# Altium schematic sheet MCU.SchDoc
size A4; SheetNumber: 2; SheetTotal: 5
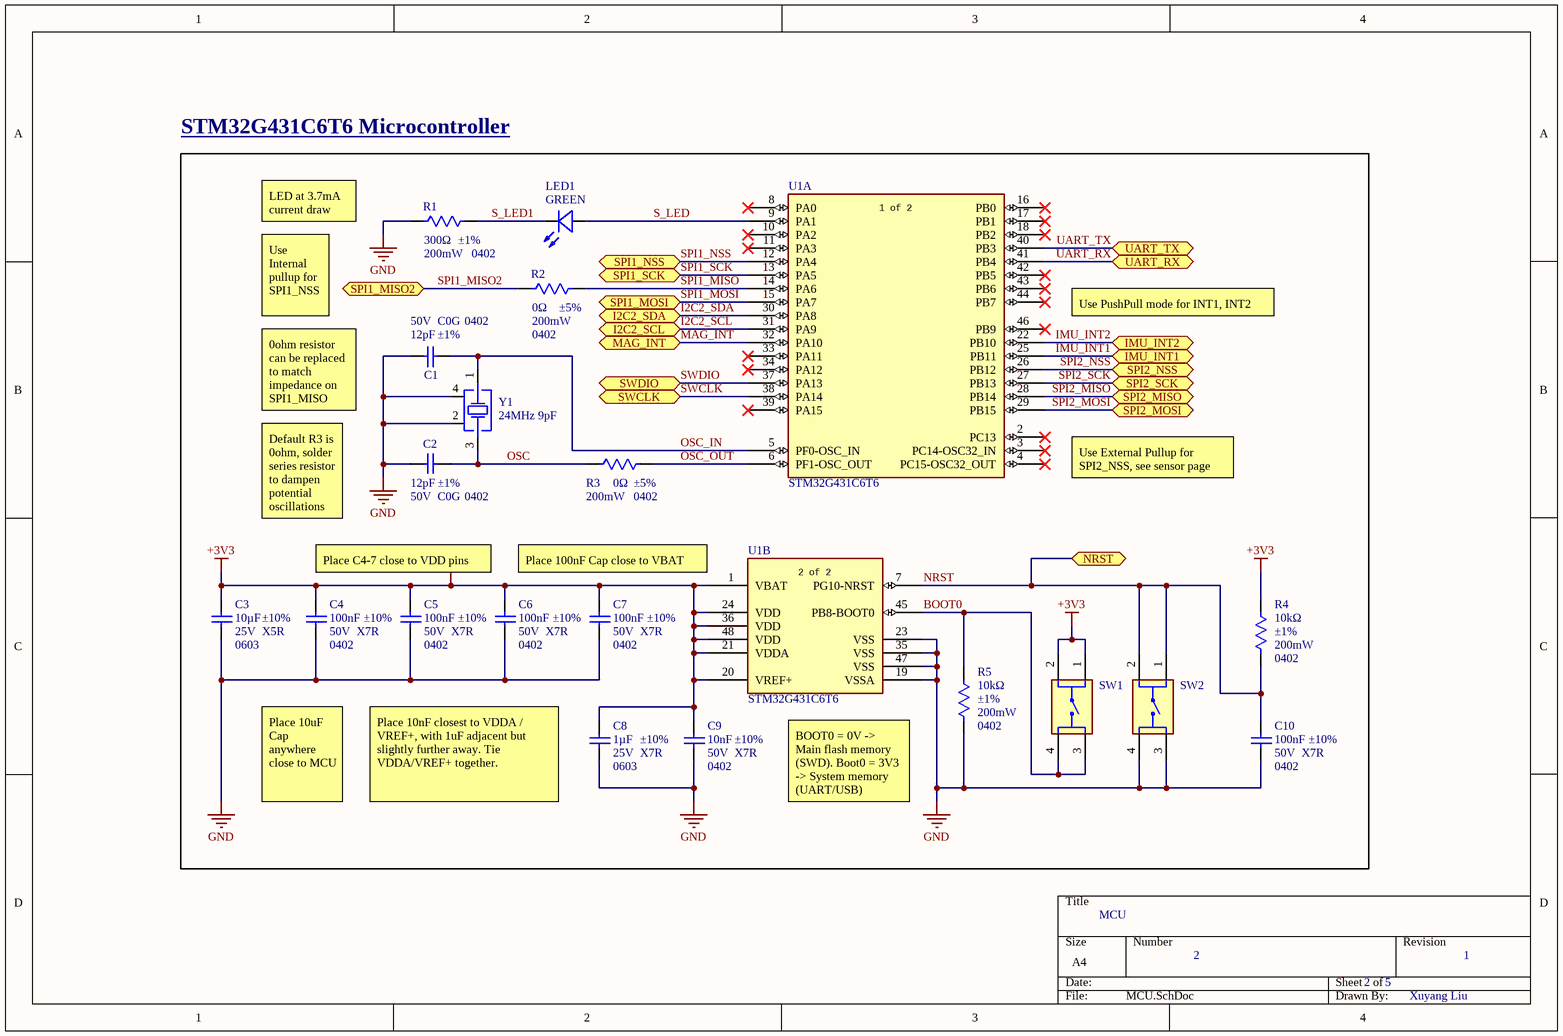
[diagram p0: MCU.SchDoc]

## Parts
C1  Voltage Rating: 50V  Tolerance: ±1%  Dielectric: C0G  Case/Package: 0402  [0402_Cap]  (hidden comment: 12pF)
C2  Voltage Rating: 50V  Tolerance: ±1%  Dielectric: C0G  Case/Package: 0402  [0402_Cap]  (hidden comment: 12pF)
C3  Voltage Rating: 25V  Tolerance: ±10%  Dielectric: X5R  Case/Package: 0603  Capacitance: 10µF  [0603_CAP]  (hidden comment: 10uF)
C4  Case/Package: 0402  Voltage Rating: 50V  Dielectric: X7R  Tolerance: ±10%  [0402_Cap]  (hidden comment: 100nF)
C5  Case/Package: 0402  Voltage Rating: 50V  Dielectric: X7R  Tolerance: ±10%  [0402_Cap]  (hidden comment: 100nF)
C6  Case/Package: 0402  Voltage Rating: 50V  Dielectric: X7R  Tolerance: ±10%  [0402_Cap]  (hidden comment: 100nF)
C7  Case/Package: 0402  Voltage Rating: 50V  Dielectric: X7R  Tolerance: ±10%  [0402_Cap]  (hidden comment: 100nF)
C8  Voltage: 25V  Tolerance: ±10%  Dielectric: X7R  Case/Package: 0603  Capacitance: 1µF  [0603_CAP]  (hidden comment: 1uF)
C9  Voltage: 50V  Tolerance: ±10%  Dielectric: X7R  Case/Package: 0402  [0402_Cap]  (hidden comment: 10nF)
C10  Case/Package: 0402  Voltage Rating: 50V  Dielectric: X7R  Tolerance: ±10%  [0402_Cap]  (hidden comment: 100nF)
LED1  GREEN  [0603_LED]
R1  Tolerance: ±1%  Max Power Dissipation: 200mW  Case/Package: 0402  Resistance: 300Ω  [0402_RES]  (hidden comment: 300R)
R2  Tolerance: ±5%  Power Rating: 200mW  Case/Package: 0402  Resistance: 0Ω  [0402_RES]  (hidden comment: 0R)
R3  Tolerance: ±5%  Power Rating: 200mW  Case/Package: 0402  Resistance: 0Ω  [0402_RES]  (hidden comment: 0R)
R4  Tolerance: ±1%  Power Rating: 200mW  Case/Package: 0402  Resistance: 10kΩ  [0402_RES]  (hidden comment: 10K)
R5  Tolerance: ±1%  Power Rating: 200mW  Case/Package: 0402  Resistance: 10kΩ  [0402_RES]  (hidden comment: 10K)
SW1  SPST N.O. Button  [SW4_PTS815 SJM 250 SMTR LFS_CNK]  (value not drawn)
SW2  SPST N.O. Button  [SW4_PTS815 SJM 250 SMTR LFS_CNK]  (value not drawn)
U1  STM32G431C6T6  [LQFP48-7x7mm]  (parts A,B of 2)
Y1  24MHz 9pF  [OSCCC320X250X60]

## Blocks framed on the sheet
STM32G431C6T6 Microcontroller: C1-C10 LED1 R1-R5 SW1 SW2 U1 Y1

## Ports
I2C2_SCL (bidir), I2C2_SDA (bidir), IMU_INT1 (bidir), IMU_INT2 (bidir), MAG_INT (bidir), NRST (bidir), SPI1_MISO2 (bidir), SPI1_MOSI (bidir), SPI1_NSS (bidir), SPI1_SCK (bidir), SPI2_MISO (bidir), SPI2_MOSI (bidir), SPI2_NSS (bidir), SPI2_SCK (bidir), SWCLK (bidir), SWDIO (bidir), UART_RX (bidir), UART_TX (bidir)

## Nets
+3V3: C3.2 C4.2 C5.2 C6.2 C7.2 C8.2 C9.2 R4.2 SW1.1 SW1.2 U1.1(VBAT) U1.20(VREF+) U1.21(VDDA) U1.24(VDD) U1.36(VDD) U1.48(VDD)
GND: C1.1 C2.2 C3.1 C4.1 C5.1 C6.1 C7.1 C8.1 C9.1 C10.1 R1.1 R5.1 SW2.3 SW2.4 U1.19(VSSA) U1.23(VSS) U1.35(VSS) U1.47(VSS) Y1.2 Y1.4
BOOT0: R5.2 SW1.3 SW1.4 U1.45(PB8-BOOT0)
I2C2_SCL: U1.31(PA9) ; port I2C2_SCL
I2C2_SDA: U1.30(PA8) ; port I2C2_SDA
IMU_INT1: U1.25(PB11) ; port IMU_INT1
IMU_INT2: U1.22(PB10) ; port IMU_INT2
MAG_INT: U1.32(PA10) ; port MAG_INT
NRST: C10.2 R4.1 SW2.1 SW2.2 U1.7(PG10-NRST) ; port NRST
OSC: C2.1 R3.1 Y1.3
OSC_IN: C1.2 U1.5(PF0-OSC_IN) Y1.1
OSC_OUT: R3.2 U1.6(PF1-OSC_OUT)
S_LED: LED1.A(V+) U1.9(PA1)
S_LED1: LED1.C(V-) R1.2
SPI1_MISO: R2.2 U1.14(PA6)
SPI1_MISO2: R2.1 ; port SPI1_MISO2
SPI1_MOSI: U1.15(PA7) ; port SPI1_MOSI
SPI1_NSS: U1.12(PA4) ; port SPI1_NSS
SPI1_SCK: U1.13(PA5) ; port SPI1_SCK
SPI2_MISO: U1.28(PB14) ; port SPI2_MISO
SPI2_MOSI: U1.29(PB15) ; port SPI2_MOSI
SPI2_NSS: U1.26(PB12) ; port SPI2_NSS
SPI2_SCK: U1.27(PB13) ; port SPI2_SCK
SWCLK: U1.38(PA14) ; port SWCLK
SWDIO: U1.37(PA13) ; port SWDIO
UART_RX: U1.41(PB4) ; port UART_RX
UART_TX: U1.40(PB3) ; port UART_TX

Not connected (* = marked no-connect by the designer): U1 2(PC13)* 3(PC14-OSC32_IN)* 4(PC15-OSC32_OUT)* 8(PA0)* 10(PA2)* 11(PA3)* 16(PB0)* 17(PB1)* 18(PB2)* 33(PA11)* 34(PA12)* 39(PA15)* 42(PB5)* 43(PB6)* 44(PB7)* 46(PB9)*

## Notes on the sheet
- LED at 3.7mA current draw
- Use Internal pullup for SPI1_NSS
- Use PushPull mode for INT1, INT2
- 0ohm resistor can be replaced to match impedance on SPI1_MISO
- Default R3 is 0ohm, solder series resistor to dampen potential oscillations
- Use External Pullup for SPI2_NSS, see sensor page
- Place C4-7 close to VDD pins
- Place 100nF Cap close to VBAT
- Place 10uF Cap anywhere close to MCU
- (near C8) Place 10nF closest to VDDA / VREF+, with 1uF adjacent but slightly further away. Tie VDDA/VREF+ together.
- BOOT0 = 0V -> Main flash memory (SWD). Boot0 = 3V3 -> System memory (UART/USB)
- MCU
- 2
- 2     5
- 1
- Xuyang Liu
- (in symbol STM32G431C6T6, part A) 1 of 2
- (in symbol STM32G431C6T6, part B) 2 of 2

## Library data of the parts
C1 C2 = GJM1555C1H120FB01D: 12 pF, 50 V, ± 1%, C0G (NP0), 0402 [1005 Metric]; Manufacturer: Murata; Manufacturer Lifecycle Status: IN PRODUCTION; Dielectric Material: Ceramic; Temperature Coefficient: 30ppm/°C; Supplier 1: DigiKey; Manufacturer Part Number: GJM1555C1H120FB01D; RoHS: Compliant; Category: Ceramic Capacitors; Stock 1: 7555649; Pricing 1: 1=0.16, 10=0.089, 50=0.0628, 100=0.0546, 500=0.04104, 1000=0.03687, 2500=0.03246, 5000=0.02982 (USD); Case Code (Imperial): 0402; Case Code (Metric): 1005; Depth: 500µm; Export Control Classification Number (ECCN) Code: EAR99; Height: 500µm; Harmonized Tariff Schedule (HTS) Code: 8532.24.00.20; Introduction Date: 2013-11-20; Length: 1mm; Lifecycle Status: Production; Material: Ceramic; Max Operating Temperature: 125°C; Min Operating Temperature: -55°C; Mount: Surface Mount; Number of Terminals: 2; Radiation Hardening: No; REACH SVHC: Yes; Schedule B: 8532240020, 8532240020|8532240020|8532240020|8532240020|8532240020; Termination: SMD/SMT; Thickness: 500µm; Voltage Rating (DC): 50V; Width: 500µm; ComponentLink1URL: https://datasheet.octopart.com:443/GJM1555C1H120FB01D-Murata-datasheet-165579666.pdf?src-supplier=TME; ComponentLink1Description: https://datasheet.octopart.com:443/GJM1555C1H120FB01D-Murata-datasheet-165579666.pdf?src-supplier=TME; ComponentLink2URL: https://datasheet.octopart.com:443/GJM1555C1H120FB01D-Murata-datasheet-12511495.pdf?src-supplier=TME; ComponentLink2Description: https://datasheet.octopart.com:443/GJM1555C1H120FB01D-Murata-datasheet-12511495.pdf?src-supplier=TME; ComponentLink3URL: https://datasheet.octopart.com:443/GJM1555C1H120FB01D-Murata-datasheet-141266224.pdf?src-supplier=Ciiva; ComponentLink3Description: https://datasheet.octopart.com:443/GJM1555C1H120FB01D-Murata-datasheet-141266224.pdf?src-supplier=Ciiva; ComponentLink4URL: https://datasheet.octopart.com:443/GJM1555C1H120FB01D-Murata-datasheet-140665264.pdf?src-supplier=Ciiva; ComponentLink4Description: https://datasheet.octopart.com:443/GJM1555C1H120FB01D-Murata-datasheet-140665264.pdf?src-supplier=Ciiva; ComponentLink5URL: https://datasheet.octopart.com:443/GJM1555C1H120FB01D-Murata-datasheet-138724487.pdf?src-supplier=Ciiva; ComponentLink5Description: https://datasheet.octopart.com:443/GJM1555C1H120FB01D-Murata-datasheet-138724487.pdf?src-supplier=Ciiva; ComponentLink6URL: https://datasheet.octopart.com/GJM1555C1H120FB01D-Murata-datasheet-12515295.pdf; ComponentLink6Description: https://datasheet.octopart.com/GJM1555C1H120FB01D-Murata-datasheet-12515295.pdf; ComponentLink7URL: https://datasheet.octopart.com/GJM1555C1H120FB01D-Murata-datasheet-12510076.pdf; ComponentLink7Description: https://datasheet.octopart.com/GJM1555C1H120FB01D-Murata-datasheet-12510076.pdf; ComponentLink8URL: https://datasheet.octopart.com/GJM1555C1H120FB01D-Murata-datasheet-11978611.pdf; ComponentLink8Description: https://datasheet.octopart.com/GJM1555C1H120FB01D-Murata-datasheet-11978611.pdf; ComponentLink9URL: https://datasheet.octopart.com/GJM1555C1H120FB01D-Murata-datasheet-10025737.pdf; ComponentLink9Description: https://datasheet.octopart.com/GJM1555C1H120FB01D-Murata-datasheet-10025737.pdf; ComponentLink10URL: https://datasheet.octopart.com/GJM1555C1H120FB01D-Murata-datasheet-8819587.pdf; ComponentLink10Description: https://datasheet.octopart.com/GJM1555C1H120FB01D-Murata-datasheet-8819587.pdf; ComponentLink11URL: https://datasheet.octopart.com/GJM1555C1H120FB01D-Murata-datasheet-14407173.pdf; ComponentLink11Description: https://datasheet.octopart.com/GJM1555C1H120FB01D-Murata-datasheet-14407173.pdf; ComponentLink12URL: http://sigma.octopart.com:80/reach_statement/Murata-company-16.pdf?src-supplier=Compliance+Statements; ComponentLink12Description: http://sigma.octopart.com:80/reach_statement/Murata-company-16.pdf?src-supplier=Compliance+Statements; Supplier Part Number 1: 490-11190-1-ND; Capacitance: 12pF
C3 = GRM188R61E106KA73J: 25V 10uF X7R ±10% 0603 Multilayer Ceramic Capacitors MLCC - SMD/SMT ROHS; Manufacturer: Murata; Manufacturer Lifecycle Status: IN PRODUCTION; Supplier 1: DigiKey; Manufacturer Part Number: GRM188R61E106KA73J; RoHS: Compliant; Category: Ceramic Capacitors; Stock 1: 170211; Pricing 1: 1=0.26, 10=0.149, 50=0.1072, 100=0.0945, 500=0.07304, 1000=0.06643, 2500=0.05947, 5000=0.05528 (USD); Dielectric Material: Ceramic; Height: 800µm; Length: 1.6mm; Lifecycle Status: Production; Material: Ceramic; Max Operating Temperature: 85°C; Min Operating Temperature: -55°C; Mount: Surface Mount; Number of Terminals: 2; REACH SVHC: Yes; Thickness: 800µm; Voltage Rating (DC): 25V; Width: 800µm; ComponentLink1URL: https://datasheet.octopart.com:443/GRM188R61E106KA73J-Murata-datasheet-165579666.pdf?src-supplier=TME; ComponentLink1Description: https://datasheet.octopart.com:443/GRM188R61E106KA73J-Murata-datasheet-165579666.pdf?src-supplier=TME; ComponentLink2URL: https://datasheet.octopart.com:443/GRM188R61E106KA73J-Murata-datasheet-141274968.pdf?src-supplier=Ciiva; ComponentLink2Description: https://datasheet.octopart.com:443/GRM188R61E106KA73J-Murata-datasheet-141274968.pdf?src-supplier=Ciiva; ComponentLink3URL: https://datasheet.octopart.com:443/GRM188R61E106KA73J-Murata-datasheet-140704821.pdf?src-supplier=Ciiva; ComponentLink3Description: https://datasheet.octopart.com:443/GRM188R61E106KA73J-Murata-datasheet-140704821.pdf?src-supplier=Ciiva; ComponentLink4URL: https://datasheet.octopart.com:443/GRM188R61E106KA73J-Murata-datasheet-138742889.pdf?src-supplier=Ciiva; ComponentLink4Description: https://datasheet.octopart.com:443/GRM188R61E106KA73J-Murata-datasheet-138742889.pdf?src-supplier=Ciiva; ComponentLink5URL: https://datasheet.octopart.com/GRM188R61E106KA73J-Murata-datasheet-12515295.pdf; ComponentLink5Description: https://datasheet.octopart.com/GRM188R61E106KA73J-Murata-datasheet-12515295.pdf; ComponentLink6URL: https://datasheet.octopart.com/GRM188R61E106KA73J-Murata-datasheet-12510076.pdf; ComponentLink6Description: https://datasheet.octopart.com/GRM188R61E106KA73J-Murata-datasheet-12510076.pdf; ComponentLink7URL: https://datasheet.octopart.com/GRM188R61E106KA73J-Murata-datasheet-11978611.pdf; ComponentLink7Description: https://datasheet.octopart.com/GRM188R61E106KA73J-Murata-datasheet-11978611.pdf; ComponentLink8URL: https://datasheet.octopart.com/GRM188R61E106KA73J-Murata-datasheet-10025737.pdf; ComponentLink8Description: https://datasheet.octopart.com/GRM188R61E106KA73J-Murata-datasheet-10025737.pdf; ComponentLink9URL: https://datasheet.octopart.com/GRM188R61E106KA73J-Murata-datasheet-8819587.pdf; ComponentLink9Description: https://datasheet.octopart.com/GRM188R61E106KA73J-Murata-datasheet-8819587.pdf; ComponentLink10URL: http://sigma.octopart.com:80/reach_statement/Murata-company-16.pdf?src-supplier=Compliance+Statements; ComponentLink10Description: http://sigma.octopart.com:80/reach_statement/Murata-company-16.pdf?src-supplier=Compliance+Statements; Supplier Part Number 1: 490-GRM188R61E106KA73JCT-ND
C4-C7 C10 = GCM155R71H104KE02J: 50V 100nF X7R ±10% 0402 Multilayer Ceramic Capacitors MLCC - SMD/SMT ROHS; Manufacturer: Murata; Manufacturer Lifecycle Status: IN PRODUCTION; Supplier 1: DigiKey; Manufacturer Part Number: GCM155R71H104KE02J; RoHS: Compliant; Category: Ceramic Capacitors; Stock 1: 13930662; Pricing 1: 1=0.1, 10=0.034, 50=0.0226, 100=0.0193, 500=0.01374, 1000=0.01205, 2500=0.01027, 5000=0.0092 (USD); Case Code (Imperial): 0402; Case Code (Metric): 1005; Country of Origin: Philippines; Dielectric Material: Ceramic; Export Control Classification Number (ECCN) Code: EAR99; Height: 500µm; Harmonized Tariff Schedule (HTS) Code: 8532.24.00.20; Introduction Date: 2013-11-20; Length: 1mm; Lifecycle Status: Production; Material: Ceramic; Max Operating Temperature: 125°C; Min Operating Temperature: -55°C; Mount: Surface Mount; Number of Terminals: 2; Packaging: Tape & Reel (TR); Ratings: AEC-Q200; REACH SVHC: Yes; Schedule B: 8532240020, 8532240020|8532240020, 8532240020|8532240020|8532240020, 8532240020|8532240020|8532240020|8532240020; Termination: SMD/SMT; Voltage Rating (DC): 50V; Weight: 6.010099mg; Width: 500µm; ComponentLink1URL: https://datasheet.octopart.com:443/GCM155R71H104KE02J-Murata-datasheet-155345015.pdf?src-supplier=Newark; ComponentLink1Description: https://datasheet.octopart.com:443/GCM155R71H104KE02J-Murata-datasheet-155345015.pdf?src-supplier=Newark; ComponentLink2URL: https://datasheet.octopart.com:443/GCM155R71H104KE02J-Murata-datasheet-178519985.pdf?src-supplier=Arrow.cn; ComponentLink2Description: https://datasheet.octopart.com:443/GCM155R71H104KE02J-Murata-datasheet-178519985.pdf?src-supplier=Arrow.cn; ComponentLink3URL: https://datasheet.octopart.com:443/GCM155R71H104KE02J-Murata-datasheet-141266224.pdf?src-supplier=Ciiva; ComponentLink3Description: https://datasheet.octopart.com:443/GCM155R71H104KE02J-Murata-datasheet-141266224.pdf?src-supplier=Ciiva; ComponentLink4URL: https://datasheet.octopart.com:443/GCM155R71H104KE02J-Murata-datasheet-140656751.pdf?src-supplier=Ciiva; ComponentLink4Description: https://datasheet.octopart.com:443/GCM155R71H104KE02J-Murata-datasheet-140656751.pdf?src-supplier=Ciiva; ComponentLink5URL: https://datasheet.octopart.com:443/GCM155R71H104KE02J-Murata-datasheet-138716456.pdf?src-supplier=Ciiva; ComponentLink5Description: https://datasheet.octopart.com:443/GCM155R71H104KE02J-Murata-datasheet-138716456.pdf?src-supplier=Ciiva; ComponentLink6URL: https://datasheet.octopart.com:443/GCM155R71H104KE02J-Murata-datasheet-77992203.pdf?src-supplier=Future+Electronics; ComponentLink6Description: https://datasheet.octopart.com:443/GCM155R71H104KE02J-Murata-datasheet-77992203.pdf?src-supplier=Future+Electronics; ComponentLink7URL: https://datasheet.octopart.com:443/GCM155R71H104KE02J-Murata-datasheet-12511495.pdf?src-supplier=TME; ComponentLink7Description: https://datasheet.octopart.com:443/GCM155R71H104KE02J-Murata-datasheet-12511495.pdf?src-supplier=TME; ComponentLink8URL: http://sigma.octopart.com:80/reach_statement/Murata-company-16.pdf?src-supplier=Compliance+Statements; ComponentLink8Description: http://sigma.octopart.com:80/reach_statement/Murata-company-16.pdf?src-supplier=Compliance+Statements; Supplier Part Number 1: 490-14514-6-ND; Capacitance: 100nF
C8 = GCM188R71E105KA64D: 25V 1uF X7R ±10% 0603 Multilayer Ceramic Capacitors MLCC - SMD/SMT ROHS; Manufacturer: Murata; Manufacturer Lifecycle Status: IN PRODUCTION; Supplier 1: DigiKey; Manufacturer Part Number: GCM188R71E105KA64D; RoHS: Compliant; Category: Ceramic Capacitors; Stock 1: 751115; Pricing 1: 1=0.19, 10=0.106, 50=0.0752, 100=0.0658, 500=0.04994, 1000=0.04504 (USD); Case Code (Imperial): 0603; Case Code (Metric): 1608; Country of Origin: Philippines; Depth: 800µm; Dielectric Material: Ceramic; Export Control Classification Number (ECCN) Code: EAR99; Height: 800µm; Harmonized Tariff Schedule (HTS) Code: 8532.24.00.20; Introduction Date: 2010-10-29; Lead Free: Lead Free; Length: 1.6mm; Lifecycle Status: Production; Material: Ceramic; Max Operating Temperature: 125°C; Min Operating Temperature: -55°C; Mount: Surface Mount; Number of Terminals: 2; Packaging: Cut Tape; Radiation Hardening: No; Ratings: AEC-Q200; REACH SVHC: Yes; Schedule B: 8532240020, 8532240020|8532240020, 8532240020|8532240020|8532240020, 8532240020|8532240020|8532240020|8532240020; Termination: SMD/SMT; Voltage Rating: 25V; Voltage Rating (DC): 25V; Weight: 6.293594mg; Width: 800µm; ComponentLink1URL: https://datasheet.octopart.com:443/GCM188R71E105KA64D-Murata-datasheet-39128443.pdf?src-supplier=Newark; ComponentLink1Description: https://datasheet.octopart.com:443/GCM188R71E105KA64D-Murata-datasheet-39128443.pdf?src-supplier=Newark; ComponentLink2URL: https://datasheet.octopart.com:443/GCM188R71E105KA64D-Murata-datasheet-62316951.pdf?src-supplier=element14+APAC; ComponentLink2Description: https://datasheet.octopart.com:443/GCM188R71E105KA64D-Murata-datasheet-62316951.pdf?src-supplier=element14+APAC; ComponentLink3URL: https://datasheet.octopart.com:443/GCM188R71E105KA64D-Murata-datasheet-141267554.pdf?src-supplier=Geoflip; ComponentLink3Description: https://datasheet.octopart.com:443/GCM188R71E105KA64D-Murata-datasheet-141267554.pdf?src-supplier=Geoflip; ComponentLink4URL: https://datasheet.octopart.com:443/GCM188R71E105KA64D-Murata-datasheet-140658666.pdf?src-supplier=Ciiva; ComponentLink4Description: https://datasheet.octopart.com:443/GCM188R71E105KA64D-Murata-datasheet-140658666.pdf?src-supplier=Ciiva; ComponentLink5URL: https://datasheet.octopart.com:443/GCM188R71E105KA64D-Murata-datasheet-138718232.pdf?src-supplier=Ciiva; ComponentLink5Description: https://datasheet.octopart.com:443/GCM188R71E105KA64D-Murata-datasheet-138718232.pdf?src-supplier=Ciiva; ComponentLink6URL: https://datasheet.octopart.com:443/GCM188R71E105KA64D-Murata-datasheet-81455541.pdf?src-supplier=TME; ComponentLink6Description: https://datasheet.octopart.com:443/GCM188R71E105KA64D-Murata-datasheet-81455541.pdf?src-supplier=TME; ComponentLink7URL: https://datasheet.octopart.com/GCM188R71E105KA64D-Murata-datasheet-14404430.pdf; ComponentLink7Description: https://datasheet.octopart.com/GCM188R71E105KA64D-Murata-datasheet-14404430.pdf; ComponentLink8URL: https://datasheet.octopart.com:443/GCM188R71E105KA64D-Murata-datasheet-14393380.pdf?src-supplier=Future+Electronics; ComponentLink8Description: https://datasheet.octopart.com:443/GCM188R71E105KA64D-Murata-datasheet-14393380.pdf?src-supplier=Future+Electronics; ComponentLink9URL: https://datasheet.octopart.com:443/GCM188R71E105KA64D-Murata-datasheet-44103482.pdf?src-supplier=Future+Electronics; ComponentLink9Description: https://datasheet.octopart.com:443/GCM188R71E105KA64D-Murata-datasheet-44103482.pdf?src-supplier=Future+Electronics; ComponentLink10URL: http://sigma.octopart.com:80/reach_statement/Murata-company-16.pdf?src-supplier=Compliance+Statements; ComponentLink10Description: http://sigma.octopart.com:80/reach_statement/Murata-company-16.pdf?src-supplier=Compliance+Statements; Supplier Part Number 1: 490-10673-1-ND
C9 = GCM155R71H103KA55D: 50V 10nF X7R ±10% 0402 Multilayer Ceramic Capacitors MLCC - SMD/SMT ROHS; Manufacturer: Murata; Manufacturer Lifecycle Status: IN PRODUCTION; Manufacturer Part Number: GCM155R71H103KA55D; RoHS: Compliant; Category: Ceramic Capacitors; Stock 1: 3983526; Pricing 1: 1=0.1, 10=0.026, 50=0.0172, 100=0.0146, 500=0.01026, 1000=0.00894, 2500=0.00756, 5000=0.00672 (USD); Case Code (Imperial): 0402; Case Code (Metric): 1005; Country of Origin: Philippines; Depth: 500µm; Dielectric Material: Ceramic; Export Control Classification Number (ECCN) Code: EAR99; Height: 500µm; Harmonized Tariff Schedule (HTS) Code: 8532.24.00.20; Introduction Date: 2007-06-21; Lead Free: Lead Free; Length: 1mm; Lifecycle Status: Production; Material: Ceramic; Max Operating Temperature: 125°C; Min Operating Temperature: -55°C; Mount: Surface Mount; Number of Terminals: 2; Packaging: Cut Tape; Radiation Hardening: No; Ratings: AEC-Q200; REACH SVHC: Yes; Schedule B: 8532240020, 8532240020|8532240020, 8532240020|8532240020|8532240020, 8532240020|8532240020|8532240020|8532240020; Termination: SMD/SMT; Voltage Rating: 50V; Voltage Rating (DC): 50V; Width: 500µm; ComponentLink1URL: https://datasheet.octopart.com:443/GCM155R71H103KA55D-Murata-datasheet-149522462.pdf?src-supplier=Farnell; ComponentLink1Description: https://datasheet.octopart.com:443/GCM155R71H103KA55D-Murata-datasheet-149522462.pdf?src-supplier=Farnell; ComponentLink2URL: https://datasheet.octopart.com:443/GCM155R71H103KA55D-Murata-datasheet-39128434.pdf?src-supplier=Newark; ComponentLink2Description: https://datasheet.octopart.com:443/GCM155R71H103KA55D-Murata-datasheet-39128434.pdf?src-supplier=Newark; ComponentLink3URL: https://datasheet.octopart.com:443/GCM155R71H103KA55D-Murata-datasheet-62316942.pdf?src-supplier=element14+APAC; ComponentLink3Description: https://datasheet.octopart.com:443/GCM155R71H103KA55D-Murata-datasheet-62316942.pdf?src-supplier=element14+APAC; ComponentLink4URL: https://datasheet.octopart.com:443/GCM155R71H103KA55D-Murata-datasheet-12541648.pdf?src-supplier=_legacy+Avnet; ComponentLink4Description: https://datasheet.octopart.com:443/GCM155R71H103KA55D-Murata-datasheet-12541648.pdf?src-supplier=_legacy+Avnet; ComponentLink5URL: https://datasheet.octopart.com:443/GCM155R71H103KA55D-Murata-datasheet-14404350.pdf?src-supplier=Future+Electronics; ComponentLink5Description: https://datasheet.octopart.com:443/GCM155R71H103KA55D-Murata-datasheet-14404350.pdf?src-supplier=Future+Electronics; ComponentLink6URL: https://datasheet.octopart.com:443/GCM155R71H103KA55D-Murata-datasheet-44104302.pdf?src-supplier=Future+Electronics; ComponentLink6Description: https://datasheet.octopart.com:443/GCM155R71H103KA55D-Murata-datasheet-44104302.pdf?src-supplier=Future+Electronics; ComponentLink7URL: https://datasheet.octopart.com:443/GCM155R71H103KA55D-Murata-datasheet-141266224.pdf?src-supplier=Ciiva; ComponentLink7Description: https://datasheet.octopart.com:443/GCM155R71H103KA55D-Murata-datasheet-141266224.pdf?src-supplier=Ciiva; ComponentLink8URL: https://datasheet.octopart.com:443/GCM155R71H103KA55D-Murata-datasheet-140656749.pdf?src-supplier=Ciiva; ComponentLink8Description: https://datasheet.octopart.com:443/GCM155R71H103KA55D-Murata-datasheet-140656749.pdf?src-supplier=Ciiva; ComponentLink9URL: https://datasheet.octopart.com:443/GCM155R71H103KA55D-Murata-datasheet-138716454.pdf?src-supplier=Ciiva; ComponentLink9Description: https://datasheet.octopart.com:443/GCM155R71H103KA55D-Murata-datasheet-138716454.pdf?src-supplier=Ciiva; ComponentLink10URL: https://datasheet.octopart.com:443/GCM155R71H103KA55D-Murata-datasheet-12511495.pdf?src-supplier=TME; ComponentLink10Description: https://datasheet.octopart.com:443/GCM155R71H103KA55D-Murata-datasheet-12511495.pdf?src-supplier=TME; ComponentLink11URL: http://sigma.octopart.com:80/reach_statement/Murata-company-16.pdf?src-supplier=Compliance+Statements; ComponentLink11Description: http://sigma.octopart.com:80/reach_statement/Murata-company-16.pdf?src-supplier=Compliance+Statements; Supplier 1: DigiKey; Supplier Part Number 1: 490-4762-6-ND; Capacitance: 10nF
LED1 = LTST-C190KGKT: LED yellow green 0603 wavelength 567.5nm~576.5nm light intensity 18mcd~71mcd Front Mounting; Manufacturer: Diodes Inc.; Dominant Wavelength: 571nm; Forward Current: 30mA; Forward Voltage: 2.15V; Lens Color: Clear, Colorless; Lens Style: Clear; Luminous Intensity: 35mcd; Number of Circuits: 1; Peak Wavelength: 574nm; Power Dissipation: 75mW; Reverse Voltage: 5V; Shape: Rectangular; Test Current: 20mA; Viewing Angle: 130°; Supplier 1: DigiKey; Manufacturer Part Number: LTST-C190KGKT; RoHS: Compliant; Category: LEDs; Stock 1: 2033232; Pricing 1: 1=0.13, 10=0.088, 100=0.0603, 500=0.04758, 1000=0.04332, 2000=0.03968 (USD); Case/Package: 0603; Case Code (Imperial): 0603; Case Code (Metric): 1608; China RoHS: Compliant; Color: Green; Depth: 800µm; Height: 800µm; Illumination Color: Green; Lead Free: Lead Free; Length: 1.6mm; Lens Transparency: Clear; Lifecycle Status: Production; Max Operating Temperature: 85°C; Min Operating Temperature: -30°C; Mount: Surface Mount; Number of Elements: 1; Number of LEDs: 1; Number of Pins: 2; Number of Terminals: 2; Power Rating: 75mW; Radiation Hardening: No; REACH SVHC: Yes; Schedule B: 8541402000, 8541402000|8541402000|8541402000|8541402000|8541402000|8541402000|8541402000|8541402000|8541402000|8541402000|8541402000|8541402000|8541402000|8541402000|8541402000|8541402000|8541402000|8541402000|8541402000|8541402000|8541402000|8541402000|8541402000|85; Terminal Pitch: 1.5mm; Wavelength: 574nm; Width: 800µm; ComponentLink1URL: https://datasheet.octopart.com:443/LTST-C190KGKT-Lite-On-datasheet-86397316.pdf?src-supplier=ODG+(Origin+Data+Global); ComponentLink1Description: https://datasheet.octopart.com:443/LTST-C190KGKT-Lite-On-datasheet-86397316.pdf?src-supplier=ODG+(Origin+Data+Global); ComponentLink2URL: https://datasheet.octopart.com:443/LTST-C190KGKT-Lite-On-datasheet-180605179.pdf?src-supplier=IHS; ComponentLink2Description: https://datasheet.octopart.com:443/LTST-C190KGKT-Lite-On-datasheet-180605179.pdf?src-supplier=IHS; ComponentLink3URL: https://datasheet.octopart.com:443/LTST-C190KGKT-Lite-On-datasheet-13693967.pdf?src-supplier=Factory+Futures; ComponentLink3Description: https://datasheet.octopart.com:443/LTST-C190KGKT-Lite-On-datasheet-13693967.pdf?src-supplier=Factory+Futures; ComponentLink4URL: https://datasheet.octopart.com:443/LTST-C190KGKT-Lite-On-datasheet-165573809.pdf?src-supplier=TME; ComponentLink4Description: https://datasheet.octopart.com:443/LTST-C190KGKT-Lite-On-datasheet-165573809.pdf?src-supplier=TME; ComponentLink5URL: https://datasheet.octopart.com:443/LTST-C190KGKT-Lite-On-datasheet-165573808.pdf?src-supplier=TME; ComponentLink5Description: https://datasheet.octopart.com:443/LTST-C190KGKT-Lite-On-datasheet-165573808.pdf?src-supplier=TME; ComponentLink6URL: https://datasheet.octopart.com:443/LTST-C190KGKT-Lite-On-datasheet-43775815.pdf?src-supplier=TME; ComponentLink6Description: https://datasheet.octopart.com:443/LTST-C190KGKT-Lite-On-datasheet-43775815.pdf?src-supplier=TME; ComponentLink7URL: https://datasheet.octopart.com:443/LTST-C190KGKT-Lite-On-datasheet-32046999.pdf?src-supplier=Future+Electronics; ComponentLink7Description: https://datasheet.octopart.com:443/LTST-C190KGKT-Lite-On-datasheet-32046999.pdf?src-supplier=Future+Electronics; ComponentLink8URL: https://datasheet.octopart.com:443/LTST-C190KGKT-Lite-On-datasheet-8326678.pdf?src-supplier=Future+Electronics; ComponentLink8Description: https://datasheet.octopart.com:443/LTST-C190KGKT-Lite-On-datasheet-8326678.pdf?src-supplier=Future+Electronics; ComponentLink9URL: https://datasheet.octopart.com:443/LTST-C190KGKT-Lite-On-datasheet-78838574.pdf?src-supplier=Future+Electronics; ComponentLink9Description: https://datasheet.octopart.com:443/LTST-C190KGKT-Lite-On-datasheet-78838574.pdf?src-supplier=Future+Electronics; ComponentLink10URL: https://datasheet.octopart.com:443/LTST-C190KGKT-Lite-On-datasheet-158288.pdf?src-supplier=Mouser; ComponentLink10Description: https://datasheet.octopart.com:443/LTST-C190KGKT-Lite-On-datasheet-158288.pdf?src-supplier=Mouser; ComponentLink11URL: https://datasheet.octopart.com:443/LTST-C190KGKT-Lite-On-datasheet-49281.pdf?src-supplier=DigiKey; ComponentLink11Description: https://datasheet.octopart.com:443/LTST-C190KGKT-Lite-On-datasheet-49281.pdf?src-supplier=DigiKey; ComponentLink12URL: https://datasheet.octopart.com:443/LTST-C190KGKT-Lite-On-datasheet-14174998.pdf?src-supplier=iiiC; ComponentLink12Description: https://datasheet.octopart.com:443/LTST-C190KGKT-Lite-On-datasheet-14174998.pdf?src-supplier=iiiC
R1 = RCS0402300RFKED: 300Ω RCS e3 0402 0402 (1005Metric) Chip Resistor ±1% ±100ppm/C 300Ohms 0.2W 1/5W; Manufacturer: Vishay; Temperature Coefficient: 100ppm/°C; Working Voltage: 50V; Supplier 1: DigiKey; Manufacturer Part Number: RCS0402300RFKED; RoHS: Compliant; Category: Chip SMD Resistors; Stock 1: 8281; Pricing 1: 1=0.13, 10=0.06, 25=0.0464, 50=0.0386, 100=0.0325, 250=0.0264, 500=0.02292, 1000=0.02015, 5000=0.01575 (USD); China RoHS: Non-Compliant; Composition: Thick Film; Country of Origin: Israel, Mainland China; Export Control Classification Number (ECCN) Code: EAR99; Features: Automotive AEC-Q200; Height: 350µm; Harmonized Tariff Schedule (HTS) Code: 8533.21.00.30; Introduction Date: 2016-07-12; Length: 1mm; Lifecycle Status: Production; Max Operating Temperature: 155°C; Min Operating Temperature: -55°C; Mount: Surface Mount; Number of Terminals: 2; Number of Terminations: 2; Power Rating: 200mW; Ratings: AEC-Q200; REACH SVHC: Yes; Width: 500µm; ComponentLink1URL: https://datasheet.octopart.com:443/RCS0402300RFKED-Vishay-datasheet-176436275.pdf?src-supplier=IHS; ComponentLink1Description: https://datasheet.octopart.com:443/RCS0402300RFKED-Vishay-datasheet-176436275.pdf?src-supplier=IHS; ComponentLink2URL: http://sigma.octopart.com:80/rohs_statement/Vishay-company-15.pdf?src-supplier=Compliance+Statements; ComponentLink2Description: http://sigma.octopart.com:80/rohs_statement/Vishay-company-15.pdf?src-supplier=Compliance+Statements
R2 R3 = RCS04020000Z0ED: 0Ω Resistor, Jumper, 0402 [1005 Metric], Thick Film, 200 mW, 3 A, Surface Mount Device; Manufacturer: Vishay; Max Current Rating: 3A; Voltage Rating: 50V; Supplier 1: DigiKey; Manufacturer Part Number: RCS04020000Z0ED; RoHS: Compliant; Category: Chip SMD Resistors; Stock 1: 775160; Pricing 1: 1=0.1, 10=0.032, 25=0.0268, 50=0.0232, 100=0.0204, 250=0.01728, 500=0.01532, 1000=0.01364, 5000=0.01064 (USD); Case Code (Imperial): 0402; Case Code (Metric): 1005; China RoHS: Non-Compliant; Composition: Thick Film; Country of Origin: Israel, Mainland China; Export Control Classification Number (ECCN) Code: EAR99; Features: Automotive AEC-Q200; Height: 350µm; Harmonized Tariff Schedule (HTS) Code: 8533.21.00.30; Introduction Date: 2016-07-12; Length: 1mm; Lifecycle Status: Production; Max Operating Temperature: 155°C; Max Power Dissipation: 200mW; Min Operating Temperature: -55°C; Mount: Surface Mount; Number of Terminals: 2; Number of Terminations: 2; Ratings: AEC-Q200; REACH SVHC: Yes; Voltage Rating (DC): 50V; Width: 500µm; ComponentLink1URL: https://datasheet.octopart.com:443/RCS04020000Z0ED-Vishay-datasheet-176436275.pdf?src-supplier=IHS; ComponentLink1Description: https://datasheet.octopart.com:443/RCS04020000Z0ED-Vishay-datasheet-176436275.pdf?src-supplier=IHS; ComponentLink2URL: https://datasheet.octopart.com:443/RCS04020000Z0ED-Vishay-datasheet-86813749.pdf?src-supplier=Future+Electronics; ComponentLink2Description: https://datasheet.octopart.com:443/RCS04020000Z0ED-Vishay-datasheet-86813749.pdf?src-supplier=Future+Electronics; ComponentLink3URL: http://sigma.octopart.com:80/rohs_statement/Vishay-company-15.pdf?src-supplier=Compliance+Statements; ComponentLink3Description: http://sigma.octopart.com:80/rohs_statement/Vishay-company-15.pdf?src-supplier=Compliance+Statements; Supplier Part Number 1: 541-2877-6-ND
R4 R5 = CRCW040210K0FKEDHP: 10kΩ Res Thick Film 0402 10K Ohm 1% 0.2W ±100ppm/°C Molded SMD SMD Paper T/R; Manufacturer: Vishay; Manufacturer Package Identifier: CRCW0402-HPe3; Voltage Rating: 50V; Supplier 1: DigiKey; Manufacturer Part Number: CRCW040210K0FKEDHP; RoHS: Compliant; Category: Chip SMD Resistors; Stock 1: 168325; Pricing 1: 1=0.12, 10=0.057, 25=0.0436, 50=0.0362, 100=0.0303, 250=0.02452, 500=0.02122, 1000=0.0186, 5000=0.01445 (USD); Case Code (Imperial): 0402; Case Code (Metric): 1005; China RoHS: Non-Compliant; Composition: Thick Film; Contact Plating: Tin; Country of Origin: Israel, Mainland China; Depth: 500µm; Export Control Classification Number (ECCN) Code: EAR99; Height: 300µm; Harmonized Tariff Schedule (HTS) Code: 8533.21.00.30; Introduction Date: 2008-07-29; Lead Free: Lead Free; Length: 1mm; Lifecycle Status: Production; Max Operating Temperature: 155°C; Military Standard: Not; Min Operating Temperature: -55°C; Mount: Surface Mount; Number of Pins: 2; Number of Terminals: 2; Packaging: Cut Tape; Radiation Hardening: No; Ratings: AEC-Q200; REACH SVHC: Yes; Schedule B: 8533210045; Temperature Coefficient: 100ppm/°C; Termination: SMD/SMT; Voltage Rating (DC): 50V; Weight: 652.039032µg; Width: 500µm; Working Voltage: 50V; ComponentLink1URL: https://datasheet.octopart.com/CRCW040210K0FKEDHP-Vishay-datasheet-83567917.pdf; ComponentLink1Description: https://datasheet.octopart.com/CRCW040210K0FKEDHP-Vishay-datasheet-83567917.pdf; ComponentLink2URL: https://datasheet.octopart.com:443/CRCW040210K0FKEDHP-Vishay-datasheet-13148866.pdf?src-supplier=Newark; ComponentLink2Description: https://datasheet.octopart.com:443/CRCW040210K0FKEDHP-Vishay-datasheet-13148866.pdf?src-supplier=Newark; ComponentLink3URL: https://datasheet.octopart.com:443/CRCW040210K0FKEDHP-Vishay-datasheet-13131392.pdf?src-supplier=Newark; ComponentLink3Description: https://datasheet.octopart.com:443/CRCW040210K0FKEDHP-Vishay-datasheet-13131392.pdf?src-supplier=Newark; ComponentLink4URL: https://datasheet.octopart.com:443/CRCW040210K0FKEDHP-Vishay-datasheet-12593106.pdf?src-supplier=Newark; ComponentLink4Description: https://datasheet.octopart.com:443/CRCW040210K0FKEDHP-Vishay-datasheet-12593106.pdf?src-supplier=Newark; ComponentLink5URL: https://datasheet.octopart.com:443/CRCW040210K0FKEDHP-Vishay-datasheet-12544674.pdf?src-supplier=Newark; ComponentLink5Description: https://datasheet.octopart.com:443/CRCW040210K0FKEDHP-Vishay-datasheet-12544674.pdf?src-supplier=Newark; ComponentLink6URL: https://datasheet.octopart.com:443/CRCW040210K0FKEDHP-Vishay-datasheet-12531795.pdf?src-supplier=Newark; ComponentLink6Description: https://datasheet.octopart.com:443/CRCW040210K0FKEDHP-Vishay-datasheet-12531795.pdf?src-supplier=Newark; ComponentLink7URL: https://datasheet.octopart.com:443/CRCW040210K0FKEDHP-Vishay-datasheet-12518686.pdf?src-supplier=Newark; ComponentLink7Description: https://datasheet.octopart.com:443/CRCW040210K0FKEDHP-Vishay-datasheet-12518686.pdf?src-supplier=Newark; ComponentLink8URL: https://datasheet.octopart.com:443/CRCW040210K0FKEDHP-Vishay-datasheet-12509906.pdf?src-supplier=Newark; ComponentLink8Description: https://datasheet.octopart.com:443/CRCW040210K0FKEDHP-Vishay-datasheet-12509906.pdf?src-supplier=Newark; ComponentLink9URL: https://datasheet.octopart.com:443/CRCW040210K0FKEDHP-Vishay-datasheet-10669844.pdf?src-supplier=Newark; ComponentLink9Description: https://datasheet.octopart.com:443/CRCW040210K0FKEDHP-Vishay-datasheet-10669844.pdf?src-supplier=Newark; ComponentLink10URL: https://datasheet.octopart.com:443/CRCW040210K0FKEDHP-Vishay-datasheet-8703221.pdf?src-supplier=Newark; ComponentLink10Description: https://datasheet.octopart.com:443/CRCW040210K0FKEDHP-Vishay-datasheet-8703221.pdf?src-supplier=Newark; ComponentLink11URL: https://datasheet.octopart.com:443/CRCW040210K0FKEDHP.-Vishay-datasheet-78776210.pdf?src-supplier=Newark; ComponentLink11Description: https://datasheet.octopart.com:443/CRCW040210K0FKEDHP.-Vishay-datasheet-78776210.pdf?src-supplier=Newark; ComponentLink12URL: https://datasheet.octopart.com:443/CRCW040210K0FKEDHP-Vishay-datasheet-21268118.pdf?src-supplier=Newark; ComponentLink12Description: https://datasheet.octopart.com:443/CRCW040210K0FKEDHP-Vishay-datasheet-21268118.pdf?src-supplier=Newark; ComponentLink13URL: https://datasheet.octopart.com:443/CRCW040210K0FKEDHP-Vishay-datasheet-21226360.pdf?src-supplier=Newark; ComponentLink13Description: https://datasheet.octopart.com:443/CRCW040210K0FKEDHP-Vishay-datasheet-21226360.pdf?src-supplier=Newark; ComponentLink14URL: https://datasheet.octopart.com:443/CRCW040210K0FKEDHP-Vishay-Draloric-datasheet-8359436.pdf?src-supplier=Newark; ComponentLink14Description: https://datasheet.octopart.com:443/CRCW040210K0FKEDHP-Vishay-Draloric-datasheet-8359436.pdf?src-supplier=Newark; ComponentLink15URL: https://datasheet.octopart.com:443/CRCW040210K0FKEDHP-Vishay-datasheet-87136057.pdf?src-supplier=Farnell; ComponentLink15Description: https://datasheet.octopart.com:443/CRCW040210K0FKEDHP-Vishay-datasheet-87136057.pdf?src-supplier=Farnell; ComponentLink16URL: https://datasheet.octopart.com:443/CRCW040210K0FKEDHP-Vishay-datasheet-37143532.pdf?src-supplier=Farnell; ComponentLink16Description: https://datasheet.octopart.com:443/CRCW040210K0FKEDHP-Vishay-datasheet-37143532.pdf?src-supplier=Farnell; ComponentLink17URL: https://datasheet.octopart.com:443/CRCW040210K0FKEDHP-Vishay-datasheet-41195455.pdf?src-supplier=Farnell; ComponentLink17Description: https://datasheet.octopart.com:443/CRCW040210K0FKEDHP-Vishay-datasheet-41195455.pdf?src-supplier=Farnell; ComponentLink18URL: https://datasheet.octopart.com:443/CRCW040210K0FKEDHP.-Vishay-datasheet-66581887.pdf?src-supplier=Farnell; ComponentLink18Description: https://datasheet.octopart.com:443/CRCW040210K0FKEDHP.-Vishay-datasheet-66581887.pdf?src-supplier=Farnell; ComponentLink19URL: https://datasheet.octopart.com:443/CRCW040210K0FKEDHP-Vishay-datasheet-62317933.pdf?src-supplier=element14+APAC; ComponentLink19Description: https://datasheet.octopart.com:443/CRCW040210K0FKEDHP-Vishay-datasheet-62317933.pdf?src-supplier=element14+APAC; ComponentLink20URL: https://datasheet.octopart.com:443/CRCW040210K0FKEDHP-Vishay-Dale-datasheet-41169523.pdf?src-supplier=element14+APAC; ComponentLink20Description: https://datasheet.octopart.com:443/CRCW040210K0FKEDHP-Vishay-Dale-datasheet-41169523.pdf?src-supplier=element14+APAC; ComponentLink21URL: https://datasheet.octopart.com:443/CRCW040210K0FKEDHP-Vishay-datasheet-192322387.pdf?src-supplier=HQonline; ComponentLink21Description: https://datasheet.octopart.com:443/CRCW040210K0FKEDHP-Vishay-datasheet-192322387.pdf?src-supplier=HQonline; ComponentLink22URL: https://datasheet.octopart.com:443/CRCW040210K0FKEDHP-Vishay-datasheet-62316122.pdf?src-supplier=Future+Electronics; ComponentLink22Description: https://datasheet.octopart.com:443/CRCW040210K0FKEDHP-Vishay-datasheet-62316122.pdf?src-supplier=Future+Electronics; ComponentLink23URL: https://datasheet.octopart.com:443/CRCW040210K0FKEDHP-Vishay-Dale-datasheet-47688881.pdf?src-supplier=RS+(Formerly+Allied+Electronics); ComponentLink23Description: https://datasheet.octopart.com:443/CRCW040210K0FKEDHP-Vishay-Dale-datasheet-47688881.pdf?src-supplier=RS+(Formerly+Allied+Electronics); ComponentLink24URL: https://datasheet.octopart.com:443/CRCW040210K0FKEDHP-Vishay-datasheet-11548710.pdf?src-supplier=Arrow+Electronics; ComponentLink24Description: https://datasheet.octopart.com:443/CRCW040210K0FKEDHP-Vishay-datasheet-11548710.pdf?src-supplier=Arrow+Electronics; ComponentLink25URL: http://sigma.octopart.com:80/rohs_statement/Vishay-company-15.pdf?src-supplier=Compliance+Statements; ComponentLink25Description: http://sigma.octopart.com:80/rohs_statement/Vishay-company-15.pdf?src-supplier=Compliance+Statements; Supplier Part Number 1: 541-10.0KYDKR-ND
SW1 SW2 = PTS810SJM250SMTRLFS: Switch Tactile N.O. SPST Button J-Bend 0.05A 16V 150000Cycles 1.569N SMD T/R; Manufacturer: C&K Components; Actuator Length: 711.2µm; Contact Current Rating: 50mA; Contact Resistance: 500mΩ; Electrical Life: 150kcycles; Illumination Type: Non-Illuminated; Insulation Resistance: 100MΩ; Number of Positions: 1; Operating Force: 1.57N; Switch Function: Off-Mom; Switch Travel: 150µm; Supplier 1: DigiKey; Manufacturer Part Number: PTS810SJM250SMTRLFS; RoHS: Compliant; Category: Tactile Switches; Stock 1: 70955; Pricing 1: 1=0.58, 10=0.501, 25=0.4672, 100=0.4173, 250=0.38652, 500=0.36488, 1000=0.34488 (USD); Case/Package: SMD/SMT; Color: Black; Contact Plating: Silver; Country of Origin: Mainland China; Current Rating: 50mA; Depth: 4.6mm; Export Control Classification Number (ECCN) Code: EAR99; Height: 1.8mm; Harmonized Tariff Schedule (HTS) Code: 8536.50.90.40; Introduction Date: 2013-03-04; Lead Free: Lead Free; Length: 4.2mm; Life (Cycles): 150kcycles; Lifecycle Status: Production; Max Current Rating: 50mA; Max Operating Temperature: 85°C; Max Voltage Rating (DC): 16V; Mechanical Life: 150kcycles; Manufacturer Package Identifier: PTS810SJM250SMTRLFS; Min Operating Temperature: -40°C; Mount: Surface Mount; Number of Pins: 4; Orientation: Straight; REACH SVHC: Yes; Termination: Solder; Throw Configuration: SPST; Voltage Rating (DC): 16V; ComponentLink1URL: https://datasheet.octopart.com:443/PTS810SJM250SMTRLFS-C%26K-Components-datasheet-180017475.pdf?src-supplier=IHS; ComponentLink1Description: https://datasheet.octopart.com:443/PTS810SJM250SMTRLFS-C%26K-Components-datasheet-180017475.pdf?src-supplier=IHS; ComponentLink2URL: https://datasheet.octopart.com:443/PTS810SJM250SMTRLFS-C%26K-Components-datasheet-67873722.pdf?src-supplier=Upverter; ComponentLink2Description: https://datasheet.octopart.com:443/PTS810SJM250SMTRLFS-C%26K-Components-datasheet-67873722.pdf?src-supplier=Upverter; ComponentLink3URL: https://datasheet.octopart.com:443/PTS810-SJM-250-SMTR-LFS-C%26K-Components-datasheet-41562126.pdf?src-supplier=Upverter; ComponentLink3Description: https://datasheet.octopart.com:443/PTS810-SJM-250-SMTR-LFS-C%26K-Components-datasheet-41562126.pdf?src-supplier=Upverter; ComponentLink4URL: https://datasheet.octopart.com:443/PTS810SJM250SMTR-LFS-C%26K-Components-datasheet-181955281.pdf?src-supplier=Farnell; ComponentLink4Description: https://datasheet.octopart.com:443/PTS810SJM250SMTR-LFS-C%26K-Components-datasheet-181955281.pdf?src-supplier=Farnell; ComponentLink5URL: https://datasheet.octopart.com:443/PTS810SJM250SMTRLFS-C%26K-Components-datasheet-134606748.pdf?src-supplier=TME; ComponentLink5Description: https://datasheet.octopart.com:443/PTS810SJM250SMTRLFS-C%26K-Components-datasheet-134606748.pdf?src-supplier=TME; ComponentLink6URL: https://datasheet.octopart.com:443/PTS810-SJM-250-SMTR-LFS-C%26K-Components-datasheet-151508687.pdf?src-supplier=TME; ComponentLink6Description: https://datasheet.octopart.com:443/PTS810-SJM-250-SMTR-LFS-C%26K-Components-datasheet-151508687.pdf?src-supplier=TME; ComponentLink7URL: http://sigma.octopart.com:80/reach_statement/ITT-company-18.pdf?src-supplier=Compliance+Statements; ComponentLink7Description: http://sigma.octopart.com:80/reach_statement/ITT-company-18.pdf?src-supplier=Compliance+Statements
U1 = STM32G431C6T6: Microcontroller 32-Bit ARM Cortex-M4 RISC 32K-Byte Flash 3.3V 48-Pin LQFP; Manufacturer: STMicroelectronics; ADC Channels (Resolution): 17-Ch 12-Bit; DAC Channels (Resolution): 4-Ch 12-Bit; EEPROM Memory Size: 0B; Flash Memory Size: 32kB; Frequency: 170MHz; Interface: USB; Max Frequency: 48MHz; Max Supply Current: 29mA; Max Supply Voltage: 3.6V; Min Supply Voltage: 1.71V; Nominal Supply Voltage (DC): 3V; Number of A/D Converters: 2; Number of Channels: 17; Number of I2C Channels: 3; Number of I/Os: 5; Number of Interrupts: 16; Number of Timers/Counters: 12; Peripherals: POR; Supplier 1: Future Electronics; Manufacturer Part Number: STM32G431C6T6; RoHS: Compliant; Category: Microcontrollers; Stock 1: 1500; Pricing 1: 1500=2.29 (USD); Case/Package: LFQFP; China RoHS: Compliant; Core Architecture: ARM Cortex-M4; Country of Origin: Mainland China, Taiwan; Export Control Classification Number (ECCN) Code: 3A991.A.2; Height - Seated (Max): 1.6mm; Harmonized Tariff Schedule (HTS) Code: 8542.31.00.25; Introduction Date: 2019-10-29; Length: 7mm; Lifecycle Status: Production; Max Operating Temperature: 85°C; Memory Type: FLASH; Min Operating Temperature: -40°C; Number of D/A Converters: 2; Number of SPI Channels: 3; Number of Terminals: 48; Number of USART Channels: 3; RAM Size: 32kB; REACH SVHC: Yes; Schedule B: 8542310000, 8542310000|8542310000|8542310000|8542310000|8542310000; Terminal Pitch: 500µm; Width: 7mm; ComponentLink1URL: https://datasheet.octopart.com:443/STM32G431C6T6-STMicroelectronics-datasheet-159144895.pdf?src-supplier=Newark; ComponentLink1Description: https://datasheet.octopart.com:443/STM32G431C6T6-STMicroelectronics-datasheet-159144895.pdf?src-supplier=Newark; ComponentLink2URL: https://datasheet.octopart.com:443/STM32G431C6T6-STMicroelectronics-datasheet-144618855.pdf?src-supplier=TME; ComponentLink2Description: https://datasheet.octopart.com:443/STM32G431C6T6-STMicroelectronics-datasheet-144618855.pdf?src-supplier=TME; Supplier Part Number 1: STM32G431C6T6
Y1 = TSX-3225 24.0000MF15X-AC3: Crystal 24MHz ±10ppm (Tol) ±15ppm (Stability) 9pF FUND 40Ohm 4-Pin Mini-CSMD T/R; Manufacturer: Epson; ESR (Equivalent Series Resistance): 40Ω; Frequency Tolerance: 0.001%; Supplier 1: DigiKey; Manufacturer Part Number: TSX-3225 24.0000MF15X-AC3; RoHS: Compliant; Category: Crystals; Stock 1: 44842; Pricing 1: 1=0.82, 10=0.714, 25=0.6748, 50=0.647, 100=0.6202 (USD); Case/Package: SMD/SMT; China RoHS: Compliant; Frequency: 24MHz; Frequency Stability: 15ppm; Height: 609.6µm; Lead Free: Lead Free; Length: 3.2004mm; Lifecycle Status: Production; Load Capacitance: 9pF; Max Operating Temperature: 85°C; Min Operating Temperature: -40°C; Mount: Surface Mount; REACH SVHC: Yes; Schedule B: 8541600060, 8541600060|8541600060|8541600060|8541600060|8541600060; Series Resistance: 40Ω; Termination: SMD/SMT; Tolerance: 0.001%; Weight: 15.989131mg; Width: 2.4892mm; ComponentLink1URL: https://datasheet.octopart.com:443/TSX-3225-24.0000MF15X-AC3-Epson-datasheet-61114919.pdf?src-supplier=ODG+(Origin+Data+Global); ComponentLink1Description: https://datasheet.octopart.com:443/TSX-3225-24.0000MF15X-AC3-Epson-datasheet-61114919.pdf?src-supplier=ODG+(Origin+Data+Global); ComponentLink2URL: https://datasheet.octopart.com:443/TSX-322524.0000MF15X-AC3-Epson-datasheet-180707711.pdf?src-supplier=IHS; ComponentLink2Description: https://datasheet.octopart.com:443/TSX-322524.0000MF15X-AC3-Epson-datasheet-180707711.pdf?src-supplier=IHS; ComponentLink3URL: https://datasheet.octopart.com:443/TSX-3225-24.0000MF15X-AC3-Epson-datasheet-141944207.pdf?src-supplier=Arrow.cn; ComponentLink3Description: https://datasheet.octopart.com:443/TSX-3225-24.0000MF15X-AC3-Epson-datasheet-141944207.pdf?src-supplier=Arrow.cn; ComponentLink4URL: http://sigma.octopart.com:80/149135495/reach_statement/Epson-TSX-3225-24.0000MF15X-AC3.pdf?src-supplier=Compliance+Statements; ComponentLink4Description: http://sigma.octopart.com:80/149135495/reach_statement/Epson-TSX-3225-24.0000MF15X-AC3.pdf?src-supplier=Compliance+Statements; ComponentLink5URL: http://sigma.octopart.com:80/149135496/rohs_statement/Epson-TSX-3225-24.0000MF15X-AC3.pdf?src-supplier=Compliance+Statements; ComponentLink5Description: http://sigma.octopart.com:80/149135496/rohs_statement/Epson-TSX-3225-24.0000MF15X-AC3.pdf?src-supplier=Compliance+Statements